# Altium schematic sheet Ethernet_PoE.SchDoc (part 1 of 3)
size A3
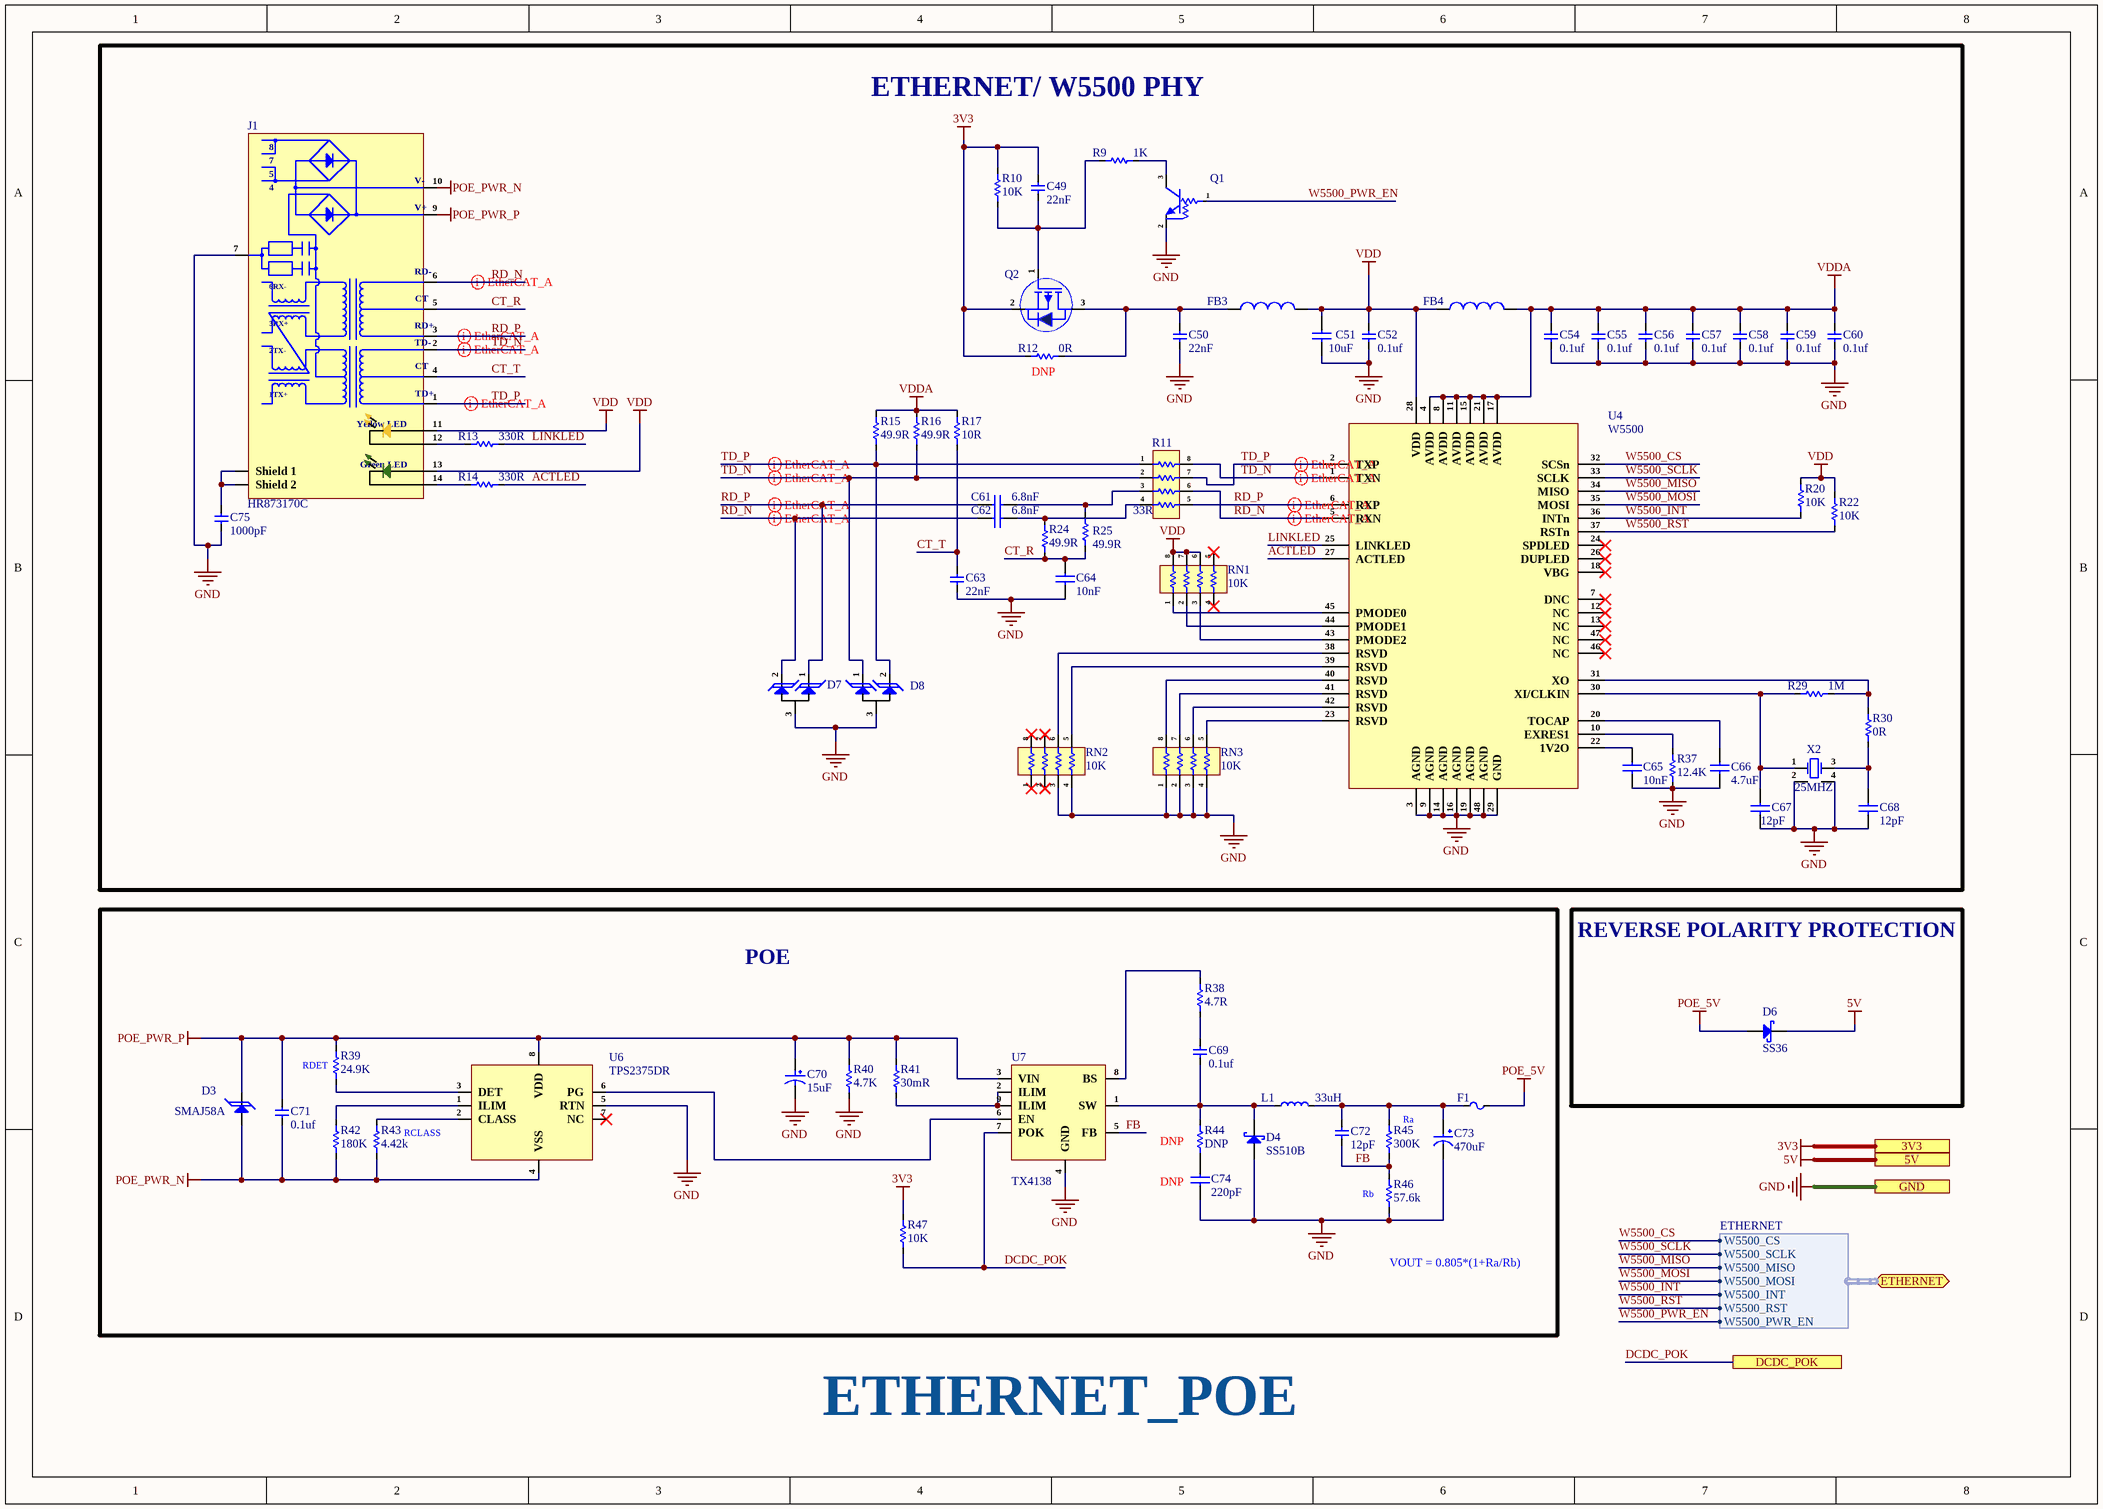
[diagram p0: Ethernet_PoE.SchDoc]

## Parts
C49  22nF  [Cap-0402]
C50  22nF  [Cap-0402]
C51  10uF  [Cap-0603]
C52  0.1uf  [Cap-0402]
C54  0.1uf  [Cap-0402]
C55  0.1uf  [Cap-0402]
C56  0.1uf  [Cap-0402]
C57  0.1uf  [Cap-0402]
C58  0.1uf  [Cap-0402]
C59  0.1uf  [Cap-0402]
C60  0.1uf  [Cap-0402]
C61  6.8nF  [Cap-0603]
C62  6.8nF  [Cap-0603]
C63  22nF  [Cap-0402]
C64  10nF  [Cap-0603]
C65  10nF  [Cap-0603]
C66  4.7uF  [Cap-0603]
C67  12pF  [Cap-0603]
C68  12pF  [Cap-0603]
C69  0.1uf  [Cap-0402]
C70  15uF  [VMMC0571J150MV]
C71  0.1uf  [Cap-0402]
C72  12pF  [Cap-0603]
C73  470uF  [Case-E]
C74  220pF  [Cap 0402]
C75  1000pF  [Cap-1206]
D3  SMAJ58A  [SMA]
D4  SS510B  [SMB_]
D6  SS36  [SMA]
D7  SP0502BAHTG  [SOT-23]  (value not drawn)
D8  SP0502BAHTG  [SOT-23]  (value not drawn)
F1  BSMD0805L-200  [Fuse-0805]  (value not drawn)
FB3  FBMH3225HM601NT  [IND-1210]  (value not drawn)
FB4  FBMH3225HM601NT  [IND-1210]  (value not drawn)
J1  HR873170C  [HR873170C]
L1  33uH  [MDA7050_330M]
Q1  LMUN2211LT1G  [SOT-23]  (value not drawn)
Q2  AO3407  [SOT-23]  (value not drawn)
R9  1K  [Res-0603]
R10  10K  [Res-0603]
R11  33R  [YC164-JR-0733RL]
R12  0R  [Res-0603]
R13  330R  [Res-0603]
R14  330R  [Res-0603]
R15  49.9R  [Res-0201]
R16  49.9R  [Res-0201]
R17  10R  [Res-0603]
R20  10K  [Res-0603]
R22  10K  [Res-0603]
R24  49.9R  [Res-0201]
R25  49.9R  [Res-0201]
R29  1M  [Res-0603]
R30  0R  [Res-0603]
R37  12.4K  [Res-0603]
R38  4.7R  [Res-0201]
R39  24.9K  [Res-0201]
R40  4.7K  [Res-0402]
R41  30mR  [RES-0805]
R42  180K  [Res-0201]
R43  4.42k  [Res-0201]
R44  DNP  [Res-0603]
R45  300K  [Res-0201]
R46  57.6k  [Res-0201]
R47  10K  [Res-0603]
RN1  10K  [YC164-FR-0710KL]
RN2  10K  [YC164-FR-0710KL]
RN3  10K  [YC164-FR-0710KL]
U4  W5500  [48-LQFP (7x7)_]
U6  TPS2375DR  [SOIC-8]
U7  TX4138  [8-SOIC-EP]
X2  25MHZ  [NX3225GA-25MHZ-STD-CRG-2]

## Blocks framed on the sheet
ETHERNET/ W5500 PHY: C49-C52 C54-C68 C75 D7 D8 FB3 FB4 J1 Q1 Q2 R9-R17 R20 R22 R24 R25 R29 R30 R37 RN1-RN3 U4 X2
POE: C69-C74 D3 D4 F1 L1 R38-R47 U6 U7
REVERSE POLARITY PROTECTION: D6

## Ports
3V3, 5V, DCDC_POK, ETHERNET (bidir, harness ETHERNET), GND

## Harnesses
ETHERNET: W5500_CS, W5500_SCLK, W5500_MISO, W5500_MOSI, W5500_PWR_EN, W5500_INT, W5500_RST

## Nets
3V3: C49.2 Q2.2(S) R10.2 R12.2 R47.2 ; port 3V3
5V: D6.1(K) ; port 5V
GND: C50.1 C51.1 C52.1 C54.1 C55.1 C56.1 C57.1 C58.1 C59.1 C60.1 C63.1 C64.1 C65.1 C66.1 C67.1 C68.1 C70.2 C73.2 C74.1 C75.1 D4.1(A) D7.3(A) D8.3(A) J1.7(GND) Q1.2(E) R37.1 R40.1 R46.1 RN2.3 RN2.4 RN3.1 RN3.2 RN3.3 RN3.4 U4.3(AGND) U4.9(AGND) U4.14(AGND) U4.16(AGND) U4.19(AGND) U4.29(GND) U4.48(AGND) U6.5(RTN) U7.4(GND) X2.2(GND) X2.4(OSC3) ; port GND
POE_5V: D6.2(A) F1.2
POE_PWR_N: C71.1 D3.2(K) J1.10(V-) R42.1 R43.1 U6.4(VSS)
POE_PWR_P: C70.1 C71.2 D3.1(K) J1.9(V+) R39.2 R40.2 R41.2 U6.8(VDD) U7.3(VIN)
VDD: C51.2 C52.2 FB3.2 FB4.1 J1.11(ANODE) J1.13(ANODE) R20.2 R22.2 RN1.6 RN1.7 RN1.8 U4.28(VDD)
VDDA: C54.2 C55.2 C56.2 C57.2 C58.2 C59.2 C60.2 FB4.2 R15.2 R16.2 R17.2 U4.4(AVDD) U4.8(AVDD) U4.11(AVDD) U4.15(AVDD) U4.17(AVDD) U4.21(AVDD)
ACTLED: R14.2 U4.27(ACTLED)
CT_R: C64.2 J1.5(CT) R24.1 R25.1
CT_T: C63.2 J1.4(CT) R17.1
DCDC_POK: R47.1 U7.7(POK) ; port DCDC_POK
FB: C72.1 R45.1 R46.2 U7.5(FB)
LINKLED: R13.2 U4.25(LINKLED)
RD_N: C62.1 D7.2(K) J1.6(RD-) R11.6 U4.5(RXN)
RD_P: C61.1 D7.1(K) J1.3(RD+) R11.5 U4.6(RXP)
TD_N: D8.1(K) J1.2(TD-) R11.2 R11.8 R16.1 U4.1(TXN)
TD_P: D8.2(K) J1.1(TD+) R11.1 R11.7 R15.1 U4.2(TXP)
W5500_CS: U4.32(SCSn) ; port ETHERNET.W5500_CS
W5500_INT: R20.1 U4.36(INTn) ; port ETHERNET.W5500_INT
W5500_MISO: U4.34(MISO) ; port ETHERNET.W5500_MISO
W5500_MOSI: U4.35(MOSI) ; port ETHERNET.W5500_MOSI
W5500_PWR_EN: Q1.1(B) ; port ETHERNET.W5500_PWR_EN
W5500_RST: R22.1 U4.37(RSTn) ; port ETHERNET.W5500_RST
W5500_SCLK: U4.33(SCLK) ; port ETHERNET.W5500_SCLK
NetC49_1: C49.1 Q2.1(G) R9.1 R10.1
NetC50_2: C50.2 FB3.1 Q2.3(D) R12.1
NetC61_2: C61.2 R11.3 R25.2
NetC62_2: C62.2 R11.4 R24.2
NetC65_2: C65.2 U4.22(1V2O)
NetC66_2: C66.2 U4.20(TOCAP)
NetC67_2: C67.2 R29.1 U4.30(XI/CLKIN) X2.1(OSC1)
NetC68_2: C68.2 R30.1 X2.3(OSC2)
NetC69_1: C69.1 D4.2(K) L1.1 R44.2 U7.1(SW)
NetC69_2: C69.2 R38.1
NetC72_2: C72.2 C73.1 F1.1 L1.2 R45.2
NetC74_2: C74.2 R44.1
NetC75_2: C75.2 J1.Shield_1 J1.Shield_2
NetJ1_12: J1.12(CATHODE) R13.1
NetJ1_14: J1.14(CATHODE) R14.1
NetQ1_3: Q1.3(C) R9.2
NetR29_2: R29.2 R30.2 U4.31(XO)
NetR37_2: R37.2 U4.10(EXRES1)
NetR38_2: R38.2 U7.8(BS)
NetR39_1: R39.1 U6.3(DET)
NetR41_1: R41.1 U7.2(ILIM) U7.9(ILIM)
NetR42_2: R42.2 U6.1(ILIM)
NetR43_2: R43.2 U6.2(CLASS)
NetRN1_1: RN1.1 U4.45(PMODE0)
NetRN1_2: RN1.2 U4.44(PMODE1)
NetRN1_3: RN1.3 U4.43(PMODE2)
NetRN2_5: RN2.5 U4.39(RSVD)
NetRN2_6: RN2.6 U4.38(RSVD)
NetRN3_5: RN3.5 U4.23(RSVD)
NetRN3_6: RN3.6 U4.42(RSVD)
NetRN3_7: RN3.7 U4.41(RSVD)
NetRN3_8: RN3.8 U4.40(RSVD)
NetU6_6: U6.6(PG) U7.6(EN)

Not connected (* = marked no-connect by the designer): RN1 4* 5*; RN2 1* 2* 7* 8*; U4 7(DNC)* 12(NC)* 13(NC)* 18(VBG)* 24(SPDLED)* 26(DUPLED)* 46(NC)* 47(NC)*; U6 7(NC)*

## Layout directives
differential pair; differential pair class EtherCAT_A_Lines; net class EtherCAT_A; rule Matched Net Lengths [Tolerance = 20mil]; rule Impedance Constraint [Min = 85.00    Max = 95.00    ]: RD_N, RD_P, TD_N, TD_P
differential pair; differential pair class Ethernet_Lines; net class Ethernet; rule Matched Net Lengths [Tolerance = 20mil]; rule Impedance Constraint [Min = 97.00    Max = 105.0    ]: RD_P, TD_N, TD_P

## Notes on the sheet
- (near R12) DNP
- (near R39) RDET
- (near R45) Ra
- RCLASS
- (near R44) DNP
- (near C74) DNP
- (near R46) Rb
- (near R46) VOUT = 0.805*(1+Ra/Rb)
- ETHERNET_POE
- (in symbol HR873170C) 8; 6RX-; 3RX+; 2TX-; 1TX+; Yellow LED; Green LED